# Altium schematic sheet Power.SchDoc
size A; SheetNumber: 5; SheetTotal: 8
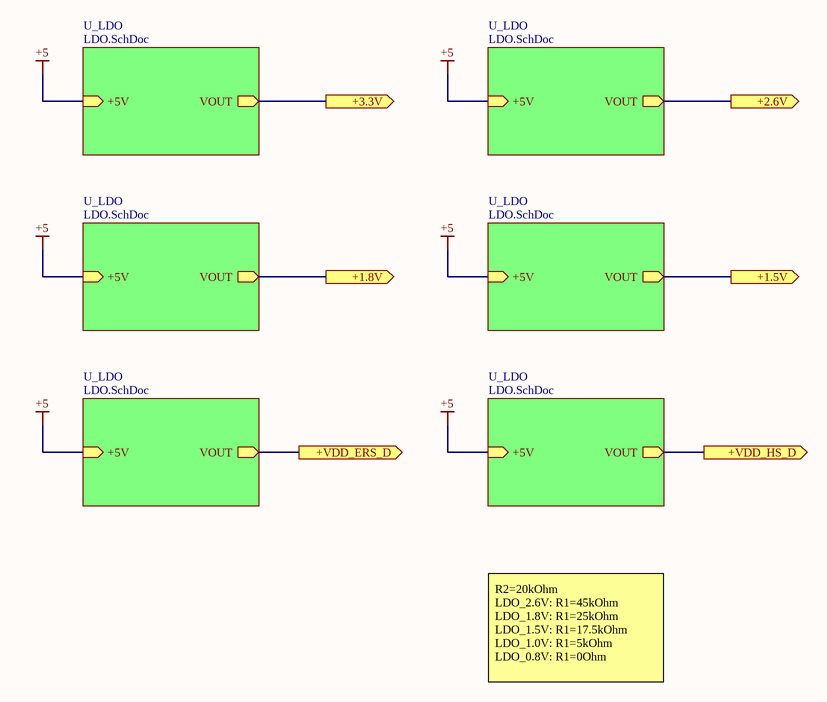
[diagram p0: Power.SchDoc]

## Sub-sheets
U_LDO = LDO.SchDoc: VOUT (out), +5V (in)
U_LDO = LDO.SchDoc: VOUT (out), +5V (in)
U_LDO = LDO.SchDoc: VOUT (out), +5V (in)
U_LDO = LDO.SchDoc: VOUT (out), +5V (in)
U_LDO = LDO.SchDoc: VOUT (out), +5V (in)
U_LDO = LDO.SchDoc: VOUT (out), +5V (in)

## Ports
+1.5V (out), +1.8V (out), +2.6V (out), +3.3V (out), +VDD_ERS_D (out), +VDD_HS_D (out)

## Nets
+5: sheet U_LDO/+5V, sheet U_LDO/+5V, sheet U_LDO/+5V, sheet U_LDO/+5V, sheet U_LDO/+5V, sheet U_LDO/+5V
+1.5V: port +1.5V, sheet U_LDO/VOUT
+1.8V: port +1.8V, sheet U_LDO/VOUT
+2.6V: port +2.6V, sheet U_LDO/VOUT
+3.3V: port +3.3V, sheet U_LDO/VOUT
+VDD_ERS_D: port +VDD_ERS_D, sheet U_LDO/VOUT
+VDD_HS_D: port +VDD_HS_D, sheet U_LDO/VOUT

## Notes on the sheet
- R2=20kOhm
  LDO_2.6V: R1=45kOhm
  LDO_1.8V: R1=25kOhm
  LDO_1.5V: R1=17.5kOhm
  LDO_1.0V: R1=5kOhm
  LDO_0.8V: R1=0Ohm